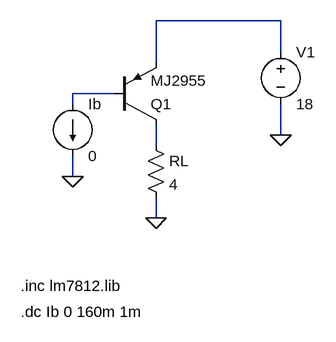
[diagram p0: schematic test_pnp.asc]
test_pnp.asc, the LTspice schematic file:
Version 4
SHEET 1 880 680
WIRE 256 -64 64 -64
WIRE 256 -16 256 -64
WIRE 64 0 64 -64
WIRE 0 48 -64 48
WIRE -64 64 -64 48
WIRE 256 112 256 64
WIRE 64 128 64 96
WIRE -64 176 -64 144
WIRE 64 240 64 208
FLAG 256 112 0
FLAG -64 176 0
FLAG 64 240 0
SYMBOL pnp 0 96 M180
SYMATTR InstName Q1
SYMATTR Value MJ2955
SYMBOL voltage 256 -32 R0
WINDOW 123 0 0 Left 0
WINDOW 39 0 0 Left 0
SYMATTR InstName V1
SYMATTR Value 18
SYMBOL current -64 64 R0
WINDOW 123 0 0 Left 0
WINDOW 39 0 0 Left 0
SYMATTR InstName Ib
SYMATTR Value 0
SYMBOL res 48 112 R0
SYMATTR InstName RL
SYMATTR Value 4
TEXT -144 344 Left 2 !.inc lm7812.lib
TEXT -144 384 Left 2 !.dc Ib 0 160m 1m

The netlist it stands for:
* test_pnp.asc
Q1 N003 N002 N001 0 MJ2955
V1 N001 0 18
Ib N002 0 0
RL N003 0 4
.model NPN NPN
.model PNP PNP
.lib standard.bjt
.inc lm7812.lib
.dc Ib 0 160m 1m
.backanno
.end